# Altium project GTV3.5_Board.PrjPcb (part 1 of 12)
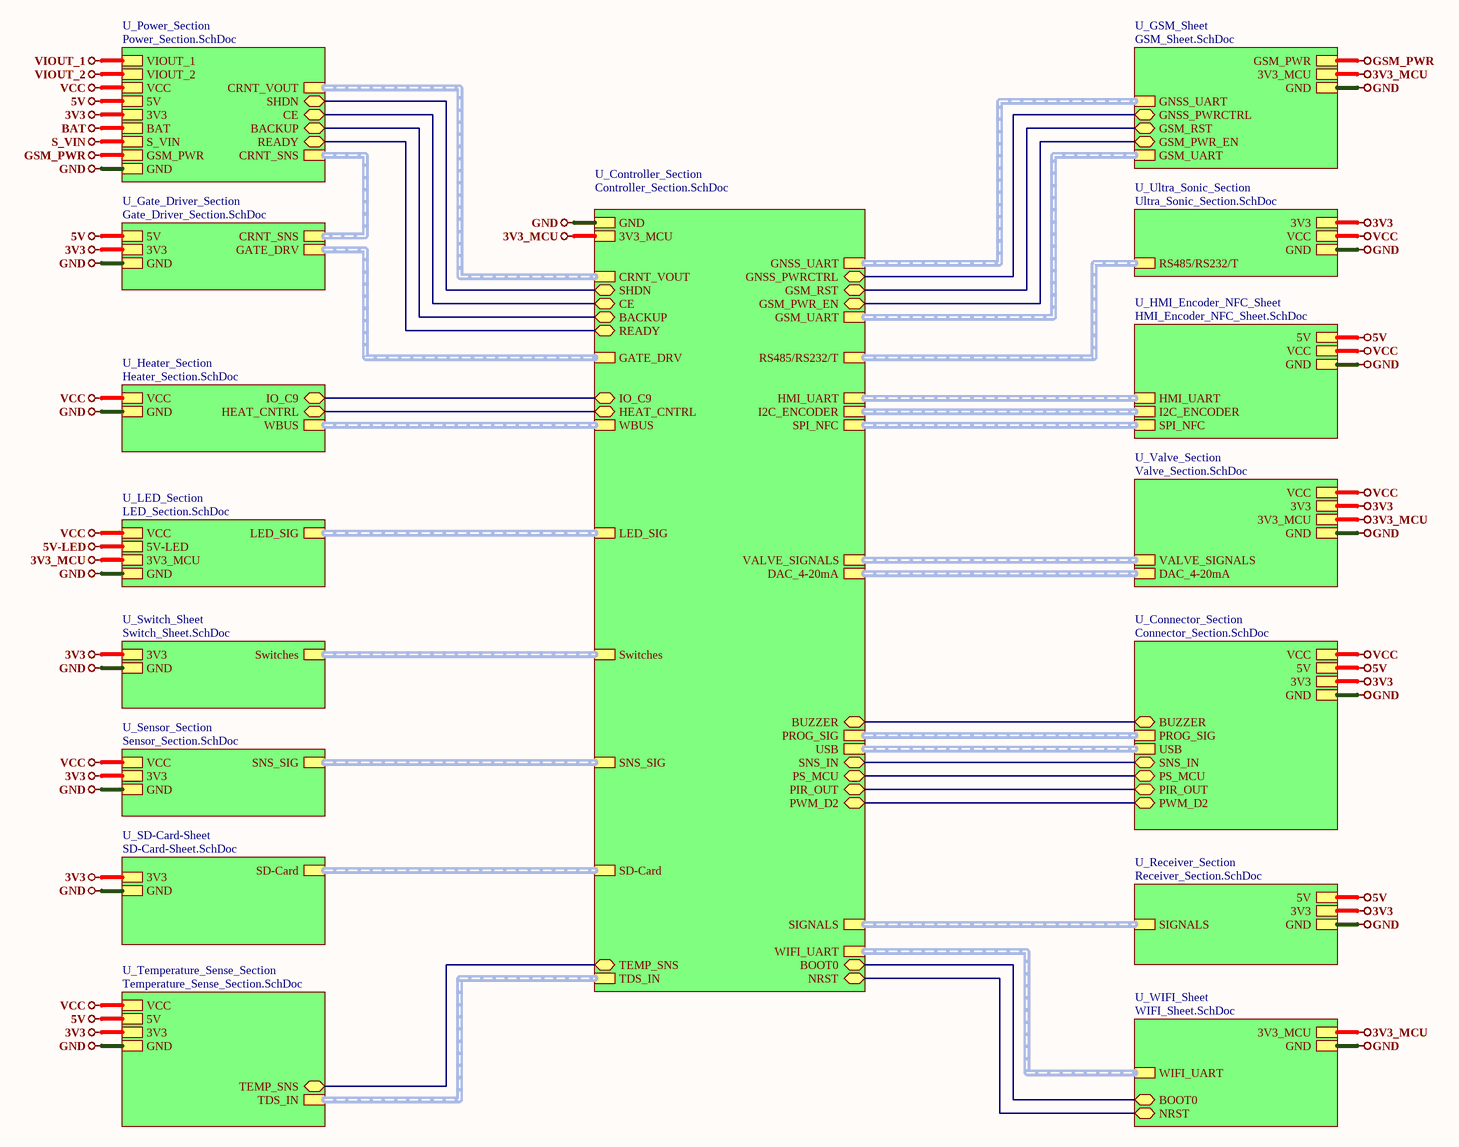
[diagram p0: Top_Sheet.SchDoc]
22 sheets, 594 parts. Net scope: hierarchical (ports join the sheet entries above them; power ports are global).
Board file: PCB_GTV3.5.PcbDoc
Sheets:
  Top_Sheet.SchDoc
    U_Power_Section = Power_Section.SchDoc
      U_Current_Sense_Section = Current_Sense_Section.SchDoc
      U_Voltage_Monitoring_Section = Voltage_Monitoring_Section.SchDoc
      U_Regulator_Section = Regulator_Section.SchDoc
      U_Reverse Protection_Section = Reverse Protection_Section.SchDoc
      U_Solar_Charge_Controller = Solar_Charge_Controller.SchDoc
    U_Connector_Section = Connector_Section.SchDoc
    U_Receiver_Section = Receiver_Section.SchDoc
    U_Controller_Section = Controller_Section.SchDoc
    U_GSM_Sheet = GSM_Sheet.SchDoc
    U_SD-Card-Sheet = SD-Card-Sheet.SchDoc
    U_WIFI_Sheet = WIFI_Sheet.SchDoc
    U_Valve_Section = Valve_Section.SchDoc
    U_Temperature_Sense_Section = Temperature_Sense_Section.SchDoc
    U_Sensor_Section = Sensor_Section.SchDoc
    U_Gate_Driver_Section = Gate_Driver_Section.SchDoc
    U_Switch_Sheet = Switch_Sheet.SchDoc
    U_LED_Section = LED_Section.SchDoc
    U_HMI_Encoder_NFC_Sheet = HMI_Encoder_NFC_Sheet.SchDoc
    U_Ultra_Sonic_Section = Ultra_Sonic_Section.SchDoc
    U_Heater_Section = Heater_Section.SchDoc

## Sheet Top_Sheet.SchDoc
size 420 x 297 mm; DocumentNumber: 1; SheetNumber: 1; SheetTotal: 17

### Sub-sheets
U_Connector_Section = Connector_Section.SchDoc: PROG_SIG (harness PROG_SIG), BUZZER (bidir), VCC, 5V, 3V3, GND, PS_MCU (bidir), SNS_IN (bidir), PIR_OUT (bidir), USB (harness USB), PWM_D2 (bidir)
U_Controller_Section = Controller_Section.SchDoc: PROG_SIG (harness PROG_SIG), BUZZER (bidir), GATE_DRV (harness GATE_DRV), IO_C9 (bidir), GND, 3V3_MCU, SHDN (bidir), Switches (harness Switches), LED_SIG (harness LED_SIG), HEAT_CNTRL (bidir), VALVE_SIGNALS (harness VALVE_SIGNALS), SNS_SIG (harness SNS_SIG), PS_MCU (bidir), SNS_IN (bidir), SIGNALS (harness RF_SIG), PIR_OUT (bidir), CRNT_VOUT (harness CRNT_VOUT), TDS_IN (harness TDS_IN), USB (harness USB), PWM_D2 (bidir), CE (bidir), I2C_ENCODER (harness VALVE_SIGNALS), HMI_UART (harness VALVE_SIGNALS), GSM_UART (harness GSM_UART), GSM_PWR_EN (bidir), GSM_RST (bidir), TEMP_SNS (bidir), SPI_NFC (harness VALVE_SIGNALS), RS485/RS232/T (harness RS485/RS232/T), SD-Card (harness SD-Card), GNSS_PWRCTRL (bidir), READY (bidir), BACKUP (bidir), WIFI_UART (harness PROG_SIG), DAC_4-20mA (harness RF_SIG), BOOT0 (bidir), NRST (bidir), GNSS_UART (harness GSM_UART), WBUS (harness WBUS)
U_Gate_Driver_Section = Gate_Driver_Section.SchDoc: GATE_DRV (harness GATE_DRV), 5V, GND, CRNT_SNS (harness CRNT_SNS), 3V3
U_GSM_Sheet = GSM_Sheet.SchDoc: GSM_UART (harness GSM_UART), GND, GSM_PWR, 3V3_MCU, GSM_RST (bidir), GSM_PWR_EN (bidir), GNSS_PWRCTRL (bidir), GNSS_UART (harness GSM_UART)
U_Heater_Section = Heater_Section.SchDoc: IO_C9 (bidir), VCC, GND, HEAT_CNTRL (bidir), WBUS (harness WBUS)
U_HMI_Encoder_NFC_Sheet = HMI_Encoder_NFC_Sheet.SchDoc: 5V, GND, HMI_UART (harness HMI_UART), I2C_ENCODER (harness ENCODER), VCC, SPI_NFC (harness ENCODER)
U_LED_Section = LED_Section.SchDoc: LED_SIG (harness LED_SIG), VCC, GND, 5V-LED, 3V3_MCU
U_Power_Section = Power_Section.SchDoc: VIOUT_1, VIOUT_2, VCC, 5V, 3V3, GND, CRNT_SNS (harness CRNT_SNS), SHDN (bidir), CRNT_VOUT (harness CRNT_VOUT), BAT, S_VIN, CE (bidir), GSM_PWR, BACKUP (bidir), READY (bidir)
U_Receiver_Section = Receiver_Section.SchDoc: SIGNALS (harness RF_SIG), 5V, GND, 3V3
U_SD-Card-Sheet = SD-Card-Sheet.SchDoc: SD-Card (harness SD-Card), 3V3, GND
U_Sensor_Section = Sensor_Section.SchDoc: SNS_SIG (harness SNS_SIG), VCC, GND, 3V3
U_Switch_Sheet = Switch_Sheet.SchDoc: Switches (harness Switches), GND, 3V3
U_Temperature_Sense_Section = Temperature_Sense_Section.SchDoc: 5V, GND, 3V3, TDS_IN (harness TDS_IN), TEMP_SNS (bidir), VCC
U_Ultra_Sonic_Section = Ultra_Sonic_Section.SchDoc: GND, 3V3, RS485/RS232/T (harness RS485/RS232/T), VCC
U_Valve_Section = Valve_Section.SchDoc: VALVE_SIGNALS (harness VALVE_SIGNALS), VCC, GND, DAC_4-20mA (harness RF_SIG), 3V3, 3V3_MCU
U_WIFI_Sheet = WIFI_Sheet.SchDoc: 3V3_MCU, GND, WIFI_UART (harness PROG_SIG), NRST (bidir), BOOT0 (bidir)

### Nets
3V3: sheet U_Power_Section/3V3, sheet U_Connector_Section/3V3, sheet U_Receiver_Section/3V3, sheet U_SD-Card-Sheet/3V3, sheet U_Valve_Section/3V3, sheet U_Temperature_Sense_Section/3V3, sheet U_Sensor_Section/3V3, sheet U_Gate_Driver_Section/3V3, sheet U_Switch_Sheet/3V3, sheet U_Ultra_Sonic_Section/3V3
3V3_MCU: sheet U_Controller_Section/3V3_MCU, sheet U_GSM_Sheet/3V3_MCU, sheet U_WIFI_Sheet/3V3_MCU, sheet U_Valve_Section/3V3_MCU, sheet U_LED_Section/3V3_MCU
5V: sheet U_Power_Section/5V, sheet U_Connector_Section/5V, sheet U_Receiver_Section/5V, sheet U_Temperature_Sense_Section/5V, sheet U_Gate_Driver_Section/5V, sheet U_HMI_Encoder_NFC_Sheet/5V
GND: sheet U_Power_Section/GND, sheet U_Connector_Section/GND, sheet U_Receiver_Section/GND, sheet U_Controller_Section/GND, sheet U_GSM_Sheet/GND, sheet U_SD-Card-Sheet/GND, sheet U_WIFI_Sheet/GND, sheet U_Valve_Section/GND, sheet U_Temperature_Sense_Section/GND, sheet U_Sensor_Section/GND, sheet U_Gate_Driver_Section/GND, sheet U_Switch_Sheet/GND, sheet U_LED_Section/GND, sheet U_HMI_Encoder_NFC_Sheet/GND, sheet U_Ultra_Sonic_Section/GND, sheet U_Heater_Section/GND
GSM_PWR: sheet U_Power_Section/GSM_PWR, sheet U_GSM_Sheet/GSM_PWR
VCC: sheet U_Power_Section/VCC, sheet U_Connector_Section/VCC, sheet U_Valve_Section/VCC, sheet U_Temperature_Sense_Section/VCC, sheet U_Sensor_Section/VCC, sheet U_LED_Section/VCC, sheet U_HMI_Encoder_NFC_Sheet/VCC, sheet U_Ultra_Sonic_Section/VCC, sheet U_Heater_Section/VCC
VIOUT_1: sheet U_Power_Section/VIOUT_1
VIOUT_2: sheet U_Power_Section/VIOUT_2
BACKUP: sheet U_Power_Section/BACKUP, sheet U_Controller_Section/BACKUP
BOOT0: sheet U_Controller_Section/BOOT0, sheet U_WIFI_Sheet/BOOT0
BUZZER: sheet U_Connector_Section/BUZZER, sheet U_Controller_Section/BUZZER
CE: sheet U_Power_Section/CE, sheet U_Controller_Section/CE
GNSS_PWRCTRL: sheet U_Controller_Section/GNSS_PWRCTRL, sheet U_GSM_Sheet/GNSS_PWRCTRL
GSM_PWR_EN: sheet U_Controller_Section/GSM_PWR_EN, sheet U_GSM_Sheet/GSM_PWR_EN
GSM_RST: sheet U_Controller_Section/GSM_RST, sheet U_GSM_Sheet/GSM_RST
HEAT_CNTRL: sheet U_Controller_Section/HEAT_CNTRL, sheet U_Heater_Section/HEAT_CNTRL
IO_C9: sheet U_Controller_Section/IO_C9, sheet U_Heater_Section/IO_C9
NRST: sheet U_Controller_Section/NRST, sheet U_WIFI_Sheet/NRST
PIR_OUT: sheet U_Connector_Section/PIR_OUT, sheet U_Controller_Section/PIR_OUT
PS_MCU: sheet U_Connector_Section/PS_MCU, sheet U_Controller_Section/PS_MCU
PWM_D2: sheet U_Connector_Section/PWM_D2, sheet U_Controller_Section/PWM_D2
READY: sheet U_Power_Section/READY, sheet U_Controller_Section/READY
SHDN: sheet U_Power_Section/SHDN, sheet U_Controller_Section/SHDN
SNS_IN: sheet U_Connector_Section/SNS_IN, sheet U_Controller_Section/SNS_IN
TEMP_SNS: sheet U_Controller_Section/TEMP_SNS, sheet U_Temperature_Sense_Section/TEMP_SNS

### Buses and harness runs
harness sheet U_Connector_Section/PROG_SIG = sheet U_Controller_Section/PROG_SIG
harness sheet U_Connector_Section/USB = sheet U_Controller_Section/USB
harness sheet U_Controller_Section/CRNT_VOUT = sheet U_Power_Section/CRNT_VOUT
harness sheet U_Controller_Section/DAC_4-20mA = sheet U_Valve_Section/DAC_4-20mA
harness sheet U_Controller_Section/GATE_DRV = sheet U_Gate_Driver_Section/GATE_DRV
harness sheet U_Controller_Section/GNSS_UART = sheet U_GSM_Sheet/GNSS_UART
harness sheet U_Controller_Section/GSM_UART = sheet U_GSM_Sheet/GSM_UART
harness sheet U_Controller_Section/HMI_UART = sheet U_HMI_Encoder_NFC_Sheet/HMI_UART
harness sheet U_Controller_Section/I2C_ENCODER = sheet U_HMI_Encoder_NFC_Sheet/I2C_ENCODER
harness sheet U_Controller_Section/LED_SIG = sheet U_LED_Section/LED_SIG
harness sheet U_Controller_Section/RS485/RS232/T = sheet U_Ultra_Sonic_Section/RS485/RS232/T
harness sheet U_Controller_Section/SD-Card = sheet U_SD-Card-Sheet/SD-Card
harness sheet U_Controller_Section/SIGNALS = sheet U_Receiver_Section/SIGNALS
harness sheet U_Controller_Section/SNS_SIG = sheet U_Sensor_Section/SNS_SIG
harness sheet U_Controller_Section/SPI_NFC = sheet U_HMI_Encoder_NFC_Sheet/SPI_NFC
harness sheet U_Controller_Section/Switches = sheet U_Switch_Sheet/Switches
harness sheet U_Controller_Section/TDS_IN = sheet U_Temperature_Sense_Section/TDS_IN
harness sheet U_Controller_Section/VALVE_SIGNALS = sheet U_Valve_Section/VALVE_SIGNALS
harness sheet U_Controller_Section/WBUS = sheet U_Heater_Section/WBUS
harness sheet U_Controller_Section/WIFI_UART = sheet U_WIFI_Sheet/WIFI_UART
harness sheet U_Gate_Driver_Section/CRNT_SNS = sheet U_Power_Section/CRNT_SNS

### Notes on the sheet
- File:
- Title:
- Date:
- Page
- Num:
- Total:
- Drawn By: Huzaifa Ali

## Sheet Power_Section.SchDoc
size 420 x 297 mm; DocumentNumber: 2; SheetNumber: 2; SheetTotal: 17
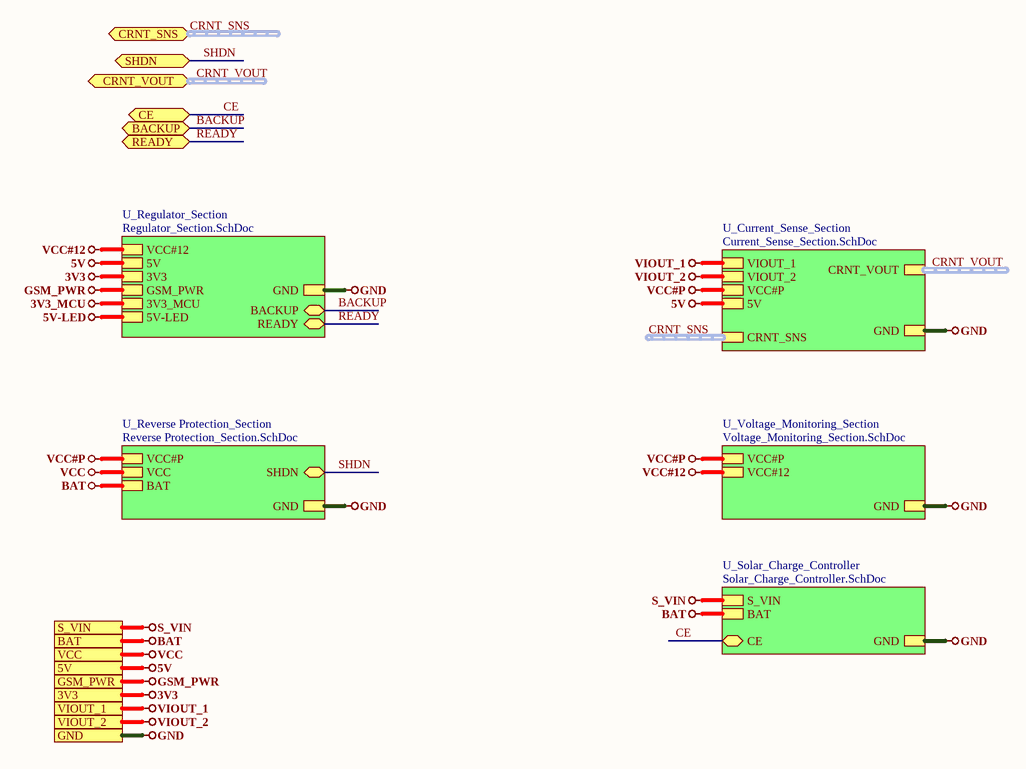
[diagram p1: Power_Section.SchDoc]

### Sub-sheets
U_Current_Sense_Section = Current_Sense_Section.SchDoc: CRNT_SNS (harness CRNT_SNS), VIOUT_1, 5V, VIOUT_2, GND, VCC#P, CRNT_VOUT (harness CRNT_VOUT)
U_Regulator_Section = Regulator_Section.SchDoc: 5V, 3V3, GND, VCC#12, GSM_PWR, BACKUP (bidir), READY (bidir), 3V3_MCU, 5V-LED
U_Reverse Protection_Section = Reverse Protection_Section.SchDoc: SHDN (bidir), VCC#P, GND, VCC, BAT
U_Solar_Charge_Controller = Solar_Charge_Controller.SchDoc: S_VIN, BAT, GND, CE (bidir)
U_Voltage_Monitoring_Section = Voltage_Monitoring_Section.SchDoc: VCC#P, GND, VCC#12

### Ports
3V3, 5V, BACKUP (bidir), BAT, CE (bidir), CRNT_SNS (bidir, harness CRNT_SNS), CRNT_VOUT (bidir, harness CRNT_VOUT), GND, GSM_PWR, READY (bidir), S_VIN, SHDN (bidir), VCC, VIOUT_1, VIOUT_2

### Nets
3V3: port 3V3, sheet U_Regulator_Section/3V3
5V: port 5V, sheet U_Current_Sense_Section/5V, sheet U_Regulator_Section/5V
BAT: port BAT, sheet U_Reverse Protection_Section/BAT, sheet U_Solar_Charge_Controller/BAT
GND: port GND, sheet U_Current_Sense_Section/GND, sheet U_Voltage_Monitoring_Section/GND, sheet U_Regulator_Section/GND, sheet U_Reverse Protection_Section/GND, sheet U_Solar_Charge_Controller/GND
GSM_PWR: port GSM_PWR, sheet U_Regulator_Section/GSM_PWR
S_VIN: port S_VIN, sheet U_Solar_Charge_Controller/S_VIN
VCC: port VCC, sheet U_Reverse Protection_Section/VCC
VCC#12: sheet U_Voltage_Monitoring_Section/VCC#12, sheet U_Regulator_Section/VCC#12
VCC#P: sheet U_Current_Sense_Section/VCC#P, sheet U_Voltage_Monitoring_Section/VCC#P, sheet U_Reverse Protection_Section/VCC#P
VIOUT_1: port VIOUT_1, sheet U_Current_Sense_Section/VIOUT_1
VIOUT_2: port VIOUT_2, sheet U_Current_Sense_Section/VIOUT_2
BACKUP: port BACKUP, sheet U_Regulator_Section/BACKUP
CE: port CE, sheet U_Solar_Charge_Controller/CE
READY: port READY, sheet U_Regulator_Section/READY
SHDN: port SHDN, sheet U_Reverse Protection_Section/SHDN

### Buses and harness runs
harness CRNT_SNS = port CRNT_SNS
harness CRNT_SNS = sheet U_Current_Sense_Section/CRNT_SNS
harness CRNT_VOUT = port CRNT_VOUT
harness CRNT_VOUT = sheet U_Current_Sense_Section/CRNT_VOUT

### Notes on the sheet
- File:
- Title:
- Date:
- Page
- Num:
- Total:
- Drawn By: Huzaifa Ali

## Sheet Current_Sense_Section.SchDoc
size 420 x 297 mm; DocumentNumber: 5; SheetNumber: 5; SheetTotal: 17
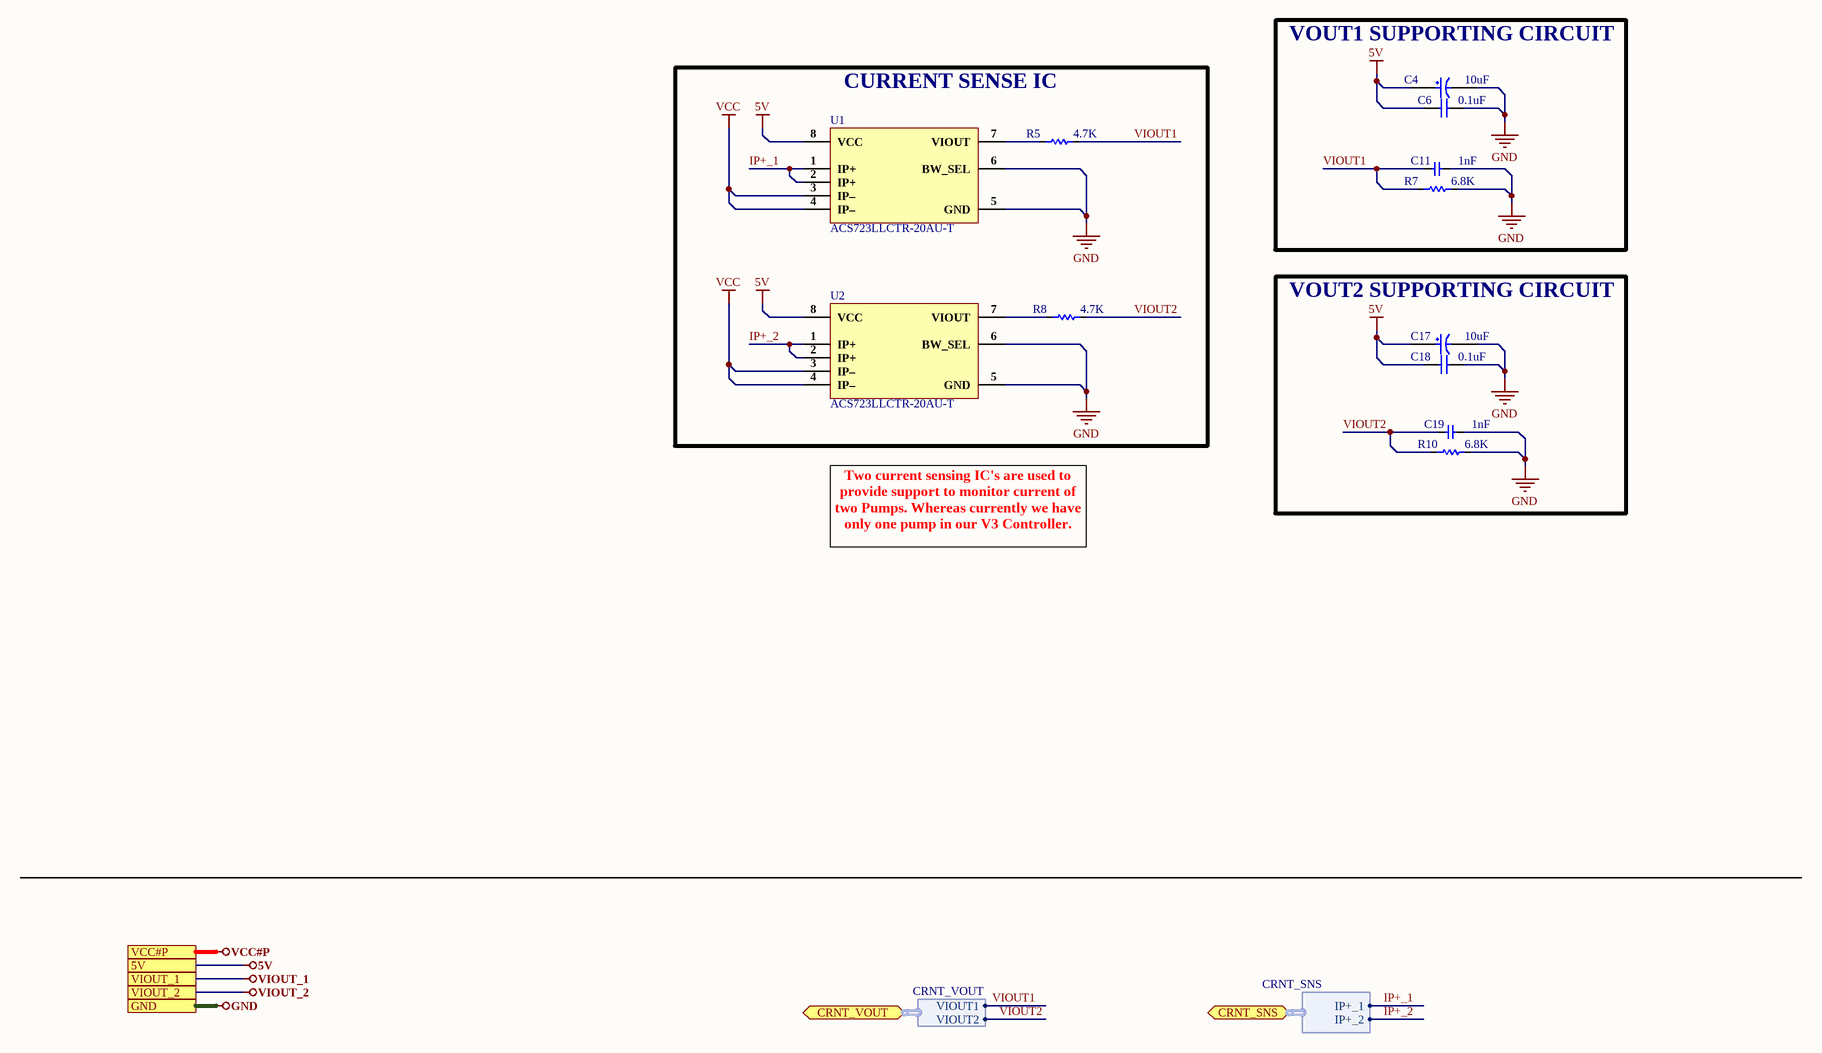
[diagram p2: Current_Sense_Section.SchDoc]

### Parts
C4  10uF  [RVT1E100M0405.]
C6  0.1uF  [Cap0603]
C11  1nF  [Cap-0402]
C17  10uF  [RVT1E100M0405.]
C18  0.1uF  [Cap0603]
C19  1nF  [Cap-0402]
R5  4.7K  [Res-0603]
R7  6.8K  [Res-0603]
R8  4.7K  [Res-0603]
R10  6.8K  [Res-0603]
U1  ACS723LLCTR-20AU-T  [SOIC-8]
U2  ACS723LLCTR-20AU-T  [SOIC-8]

### Blocks framed on the sheet
VOUT1 SUPPORTING CIRCUIT: C4 C6 C11 R7
CURRENT SENSE IC: R5 R8 U1 U2
VOUT2 SUPPORTING CIRCUIT: C17-C19 R10

### Ports
5V, CRNT_SNS (bidir, harness CRNT_SNS), CRNT_VOUT (bidir, harness CRNT_VOUT), GND, VCC#P, VIOUT_1, VIOUT_2

### Harnesses
CRNT_SNS: IP+_1, IP+_2
CRNT_VOUT: VIOUT1, VIOUT2

### Nets
5V: C4.1 C6.1 C17.1 C18.1 U1.8(VCC) U2.8(VCC) ; port 5V
GND: C4.2 C6.2 C11.2 C17.2 C18.2 C19.2 R7.2 R10.2 U1.5(GND) U1.6(BW_SEL) U2.5(GND) U2.6(BW_SEL) ; port GND
VCC: U1.3(IP–) U1.4(IP–) U2.3(IP–) U2.4(IP–)
VIOUT_1: port VIOUT_1
VIOUT_2: port VIOUT_2
IP+_1: U1.1(IP+) U1.2(IP+) ; port CRNT_SNS.IP+_1  [project net CRNT_SNS.IP+_1]
IP+_2: U2.1(IP+) U2.2(IP+) ; port CRNT_SNS.IP+_2  [project net CRNT_SNS.IP+_2]
VIOUT1: C11.1 R5.2 R7.1 ; port CRNT_VOUT.VIOUT1  [project net CRNT_VOUT.VIOUT1]
VIOUT2: C19.1 R8.2 R10.1 ; port CRNT_VOUT.VIOUT2  [project net CRNT_VOUT.VIOUT2]
NetR5_1: R5.1 U1.7(VIOUT)
NetR8_1: R8.1 U2.7(VIOUT)

### Notes on the sheet
- Two current sensing IC's are used to provide support to monitor current of two Pumps. Whereas currently we have only one pump in our V3 Controller.
- File:
- Title:
- Date:
- Page
- Num:
- Total:
- Drawn By: Huzaifa Ali

### Library data of the parts
C4 C17 = RVT1E100M0405: CAP ALUM 10uF 25V SMD; Manufacturer: ROQANG; φD: 4mm; L: 5.4mm; Tolerance: ±20%; Operating Temperature: -45℃~+105℃; Rated Voltage: 25V; Capacitance: 10uF
C6 C18 = CC0603ZRY5V9BB104: CAP CER 0.1UF 50V Y5V 0603; Manufacturer: Yageo; Capacitance: 100nF; Tolerance: 80%; Supplier 1: Digi-Key; Manufacturer Part Number: CC0603ZRY5V9BB104; Stock 1: 15000880; Pricing 1: 1=0.1, 10=0.075, 100=0.0334, 500=0.02386, 1000=0.01874 (USD); Mount: Surface Mount; Case/Package: 0603; Number of Pins: 2; Case Code (Metric): 1608; Case Code (Imperial): 0603; Min Operating Temperature: -30°C; Max Operating Temperature: 85°C; Dielectric: Y5V; Voltage Rating: 50V; Package Quantity: 1; Packaging: Tape and Reel; Voltage Rating (DC): 50V; Termination: SMD/SMT; Composition: Ceramic; Voltage: 50V; Length: 1.6mm; Height: 0.8mm; Width: 0.031inch; Thickness: 0.035inch; Depth: 0.8mm; Radiation Hardening: No; REACH SVHC: No SVHC; Lead Free: Lead Free; Halogen Free: Halogen Free; ComponentLink1URL: http://www.yageo.com/documents/recent/UPY-GPHC_Y5V_6.3V-to-50V_8.pdf?src-supplier=Digi-Key; ComponentLink1Description: http://www.yageo.com/documents/recent/UPY-GPHC_Y5V_6.3V-to-50V_8.pdf?src-supplier=Digi-Key; ComponentLink2URL: http://www.yageo.com/documents/recent/UPY-GPHC_Y5V_6.3V-to-50V_5.pdf?src-supplier=Avnet+Europe; ComponentLink2Description: http://www.yageo.com/documents/recent/UPY-GPHC_Y5V_6.3V-to-50V_5.pdf?src-supplier=Avnet+Europe; ComponentLink3URL: https://www.verical.com/server-webapp/html/getDatasheet?partID=403611&src-supplier=Verical; ComponentLink3Description: https://www.verical.com/server-webapp/html/getDatasheet?partID=403611&src-supplier=Verical; ComponentLink4URL: http://www.mouser.com/ds/2/447/Yageo_UPY-GP_NP0_16V-to-50V_9-358835.pdf?src-supplier=Mouser; ComponentLink4Description: http://www.mouser.com/ds/2/447/Yageo_UPY-GP_NP0_16V-to-50V_9-358835.pdf?src-supplier=Mouser; ComponentLink5URL: http://www.farnell.com/datasheets/1132289.pdf?src-supplier=Element14; ComponentLink5Description: http://www.farnell.com/datasheets/1132289.pdf?src-supplier=Element14; Supplier Part Number 1: 311-1343-1-ND
C11 C19 = C1005C0G1E102JT000F: CAP CER 1000PF 25V C0G 0402; Manufacturer: TDK; Item Type: Capacitor; ComponentLink1Description: LCSC; ComponentLink1URL: https://www.lcsc.com/product-detail/Multilayer-Ceramic-Capacitors-MLCC-SMD-SMT_TDK-C1005C0G1E102JT000F_C343059.html; Manufacturer Part Number: C1005C0G1E102JT000F; Package: 0402; LCSC Part Number: C343059
R5 R8 = AT0603BRD074K7L: RES SMD 4.7K OHM 0.1% 1/10W 0603; Manufacturer: Yageo; Resistance: 4.7kR; Max Power Dissipation: 100mW; Temperature Coefficient: 25ppm/°C; Item Type: Resistor; Supplier 1: Digi-Key; Manufacturer Part Number: AT0603BRD074K7L; Stock 1: 7928; Pricing 1: 1=0.56, 10=0.431, 100=0.181, 1000=0.09986, 2500=0.09362 (USD); Case/Package: 0603; Case Code (Metric): 1608; Case Code (Imperial): 0603; Min Operating Temperature: -55°C; Max Operating Temperature: 155°C; Packaging: Tape and Reel; Composition: Thin Film; Number of Terminations: 2; Tolerance: 0.1%; Features: Anti-Sulfur,Automotive AEC-Q200,Moisture Resistant; Length: 0.063inch; Height: 0.022inch; Width: 0.032inch; Supplier Part Number 1: YAG2113CT-ND; LCSC Part Number: C855887
R7 R10 = RT0603BRE076K8L: RES SMD 6.8K OHM 0.1% 1/10W 0603; Manufacturer: Yageo; Power: 100mW; Rated Temperature: 70°C; Value: 6.8kR; Temperature Coefficient: 50ppm/°C; Working Voltage: 75V; Package Height: 0.45mm; Package Length: 1.6mm; Package Width: 0.8mm; Item Type: Resistor; Supplier 1: Mouser; Manufacturer Part Number: RT0603BRE076K8L; RoHS: Yes; Category: Chip SMD Resistors; Stock 1: 1191; Pricing 1: 1=0.32000, 10=0.26800, 50=0.26800, 100=0.10500, 1000=0.04400, 10000=0.03600 (USD); Mounting Technology: Surface Mount; Pins: 2; Case/Package: 0603; Min Operating Temperature: -55°C; Max Operating Temperature: 155°C; Tolerance: 0.1%; Resistor Type: FIXED RESISTOR; Construction: Chip; Package Style: SMTMeter; Packaging: Tape and Reel; Technology: THIN FILM; Termination: Wraparound; Reach SVHC Compliant: Yes; RoHS Compliant: Yes; ComponentLink1URL: https://datasheet.ciiva.com:443/pdfs/VipMasterIC/IC/YAGO/YAGO-S-A0008510989/YAGO-S-A0008510989-1.pdf?src-supplier=IHS+Markit; ComponentLink1Description: https://datasheet.ciiva.com:443/pdfs/VipMasterIC/IC/YAGO/YAGO-S-A0008510989/YAGO-S-A0008510989-1.pdf?src-supplier=IHS+Markit; ComponentLink2URL: https://datasheet.ciiva.com/2584/pyu-rt-1-to-0-05-rohs-l-5-2584607.pdf?src-supplier=Digi-Key; ComponentLink2Description: https://datasheet.ciiva.com/2584/pyu-rt-1-to-0-05-rohs-l-5-2584607.pdf?src-supplier=Digi-Key; Supplier Part Number 1: 603-RT0603BRE076K8L; LCSC Part Number: C705876
U1 U2 = ACS723LLCTR-20AU-T: SENSOR CURRENT HALL 20A DC; Manufacturer: Allegro MicroSystems; Number of Channels: 1; Frequency: 80kHz; Response Time: 5us; Max Supply Current: 14mA; Polarity: Unidirectional; Linearity: 1%; Accuracy: 3%; Sensitivity: 200mV/A; Supplier 1: Digi-Key; Manufacturer Part Number: ACS723LLCTR-20AU-T; RoHS: Yes; Category: Current Sensors; Pricing 1: 1=4.46000, 5=3.94000, 10=3.47900, 25=2.82280, 50=2.49480, 100=2.42900, 500=2.03516, 1000=1.90385 (USD); Mount: Surface Mount; Case/Package: SOIC; Number of Pins: 8; Min Operating Temperature: -40°C; Max Operating Temperature: 150°C; Packaging: Tape and Reel; Current Sensing: 20A; RoHS Compliant: Yes; ComponentLink1URL: http://www.farnell.com/datasheets/2838158.pdf?src-supplier=Farnell; ComponentLink1Description: http://www.farnell.com/datasheets/2838158.pdf?src-supplier=Farnell; ComponentLink2URL: http://www.farnell.com/datasheets/2838158.pdf?src-supplier=Newark; ComponentLink2Description: http://www.farnell.com/datasheets/2838158.pdf?src-supplier=Newark; ComponentLink3URL: http://www.allegromicro.com/~/media/Files/Datasheets/ACS723-Datasheet.ashx?src-supplier=Digi-Key; ComponentLink3Description: http://www.allegromicro.com/~/media/Files/Datasheets/ACS723-Datasheet.ashx?src-supplier=Digi-Key; ComponentLink4URL: https://www.allegromicro.com/~/media/Files/Datasheets/ACS723-Datasheet.ashx?src-supplier=Digi-Key; ComponentLink4Description: https://www.allegromicro.com/~/media/Files/Datasheets/ACS723-Datasheet.ashx?src-supplier=Digi-Key; Supplier Part Number 1: 620-1645-1-ND

## Sheet Voltage_Monitoring_Section.SchDoc
size 420 x 297 mm; DocumentNumber: 4; SheetNumber: 4; SheetTotal: 17
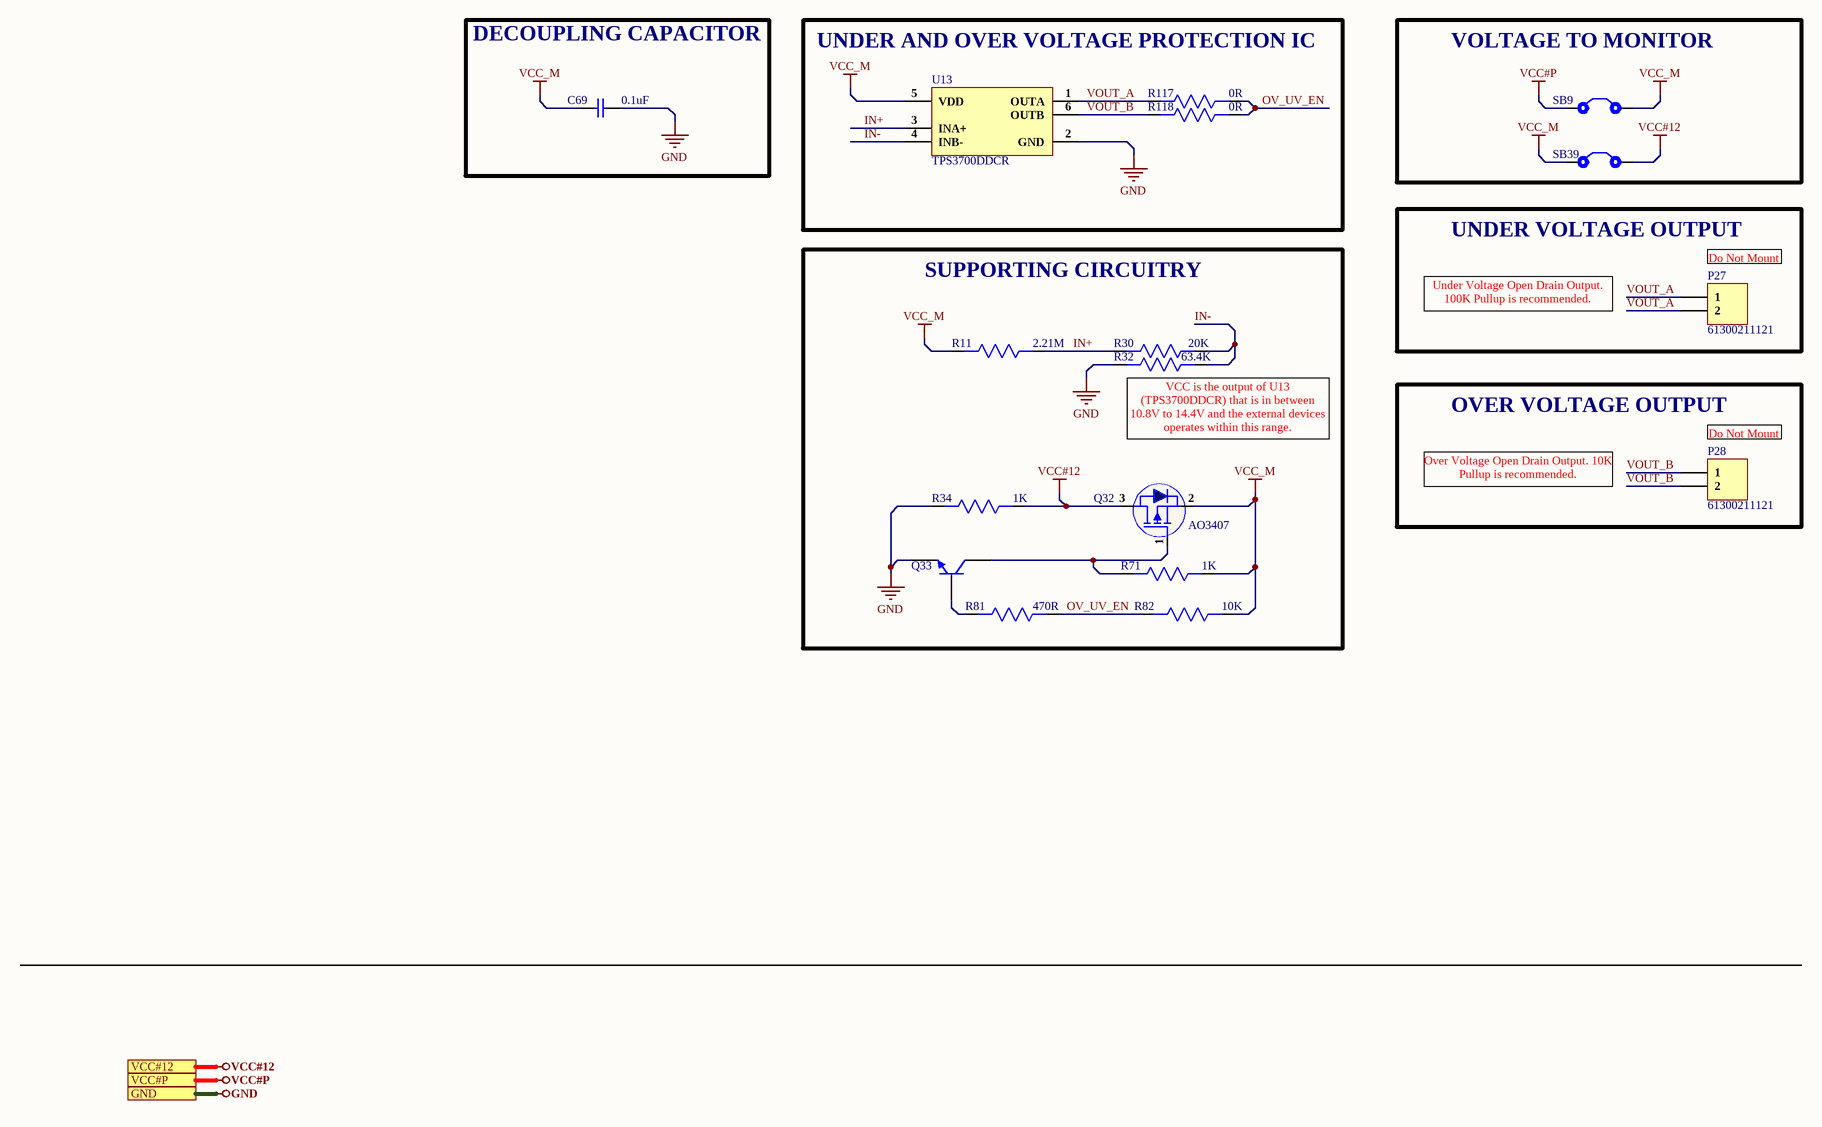
[diagram p3: Voltage_Monitoring_Section.SchDoc]

### Parts
C69  0.1uF  [Cap0603]
P27  61300211121  [HDR1X2]
P28  61300211121  [HDR1X2]
Q32  AO3407  [SOT-23]
Q33  MMBT2222A-7-F  [SOT-23]  (value not drawn)
R11  2.21M  [RES-0603]
R30  20K  [Res-0603]
R32  63.4K  [Res-0603]
R34  1K  [RES-0603]
R71  1K  [RES-0603]
R81  470R  [Res-0603]
R82  10K  [Res-0603]
R117  0R  [Res-0603]
R118  0R  [Res-0603]
SB9  Solder Bridge  [Solder Bridge]  (value not drawn)
SB39  Solder Bridge  [Solder Bridge]  (value not drawn)
U13  TPS3700DDCR  [SOT-23-6]

### Blocks framed on the sheet
DECOUPLING CAPACITOR: C69
UNDER AND OVER VOLTAGE PROTECTION IC: R117 R118 U13
VOLTAGE TO MONITOR: SB9 SB39
UNDER VOLTAGE OUTPUT: P27
SUPPORTING CIRCUITRY: Q32 Q33 R11 R30 R32 R34 R71 R81 R82
OVER VOLTAGE OUTPUT: P28

### Ports
GND, VCC#12, VCC#P

### Nets
GND: C69.2 Q33.2(E) R32.2 R34.2 U13.2(GND) ; port GND
VCC#12: Q32.3(D) R34.1 SB39.2 ; port VCC#12
VCC#P: SB9.1 ; port VCC#P
VCC_M: C69.1 Q32.2(S) R11.2 R71.1 R82.1 SB9.2 SB39.1 U13.5(VDD)
IN+: R11.1 R30.2 U13.3(INA+)
IN-: R30.1 R32.1 U13.4(INB-)
OV_UV_EN: R81.1 R82.2 R117.1 R118.1
VOUT_A: P27.1 P27.2 R117.2 U13.1(OUTA)
VOUT_B: P28.1 P28.2 R118.2 U13.6(OUTB)
NetQ32_1: Q32.1(G) Q33.3(C) R71.2
NetQ33_1: Q33.1(B) R81.2

### Notes on the sheet
- Under Voltage Open Drain Output. 100K Pullup is recommended.
- (near P27) Do Not Mount
- (near R32) VCC is the output of U13 (TPS3700DDCR) that is in between 10.8V to 14.4V and the external devices operates within this range.
- (near P28) Do Not Mount
- Over Voltage Open Drain Output. 10K Pullup is recommended.
- File:
- Title:
- Date:
- Page
- Num:
- Total:
- Drawn By: Huzaifa Ali

### Library data of the parts
C69 = CC0603ZRY5V9BB104: as C6 on sheet Current_Sense_Section; Supplier 1: Digi-Key; Manufacturer Part Number: CC0603ZRY5V9BB104; Stock 1: 15000880; Pricing 1: 1=0.1, 10=0.075, 100=0.0334, 500=0.02386, 1000=0.01874 (USD); Mount: Surface Mount; Case/Package: 0603; Number of Pins: 2; Case Code (Metric): 1608; Case Code (Imperial): 0603; Min Operating Temperature: -30°C; Max Operating Temperature: 85°C; Dielectric: Y5V; Voltage Rating: 50V; Package Quantity: 1; Packaging: Tape and Reel; Voltage Rating (DC): 50V; Termination: SMD/SMT; Composition: Ceramic; Voltage: 50V; Length: 1.6mm; Height: 0.8mm; Width: 0.031inch; Thickness: 0.035inch; Depth: 0.8mm; Radiation Hardening: No; REACH SVHC: No SVHC; Lead Free: Lead Free; Halogen Free: Halogen Free; ComponentLink1URL: http://www.yageo.com/documents/recent/UPY-GPHC_Y5V_6.3V-to-50V_8.pdf?src-supplier=Digi-Key; ComponentLink1Description: http://www.yageo.com/documents/recent/UPY-GPHC_Y5V_6.3V-to-50V_8.pdf?src-supplier=Digi-Key; ComponentLink2URL: http://www.yageo.com/documents/recent/UPY-GPHC_Y5V_6.3V-to-50V_5.pdf?src-supplier=Avnet+Europe; ComponentLink2Description: http://www.yageo.com/documents/recent/UPY-GPHC_Y5V_6.3V-to-50V_5.pdf?src-supplier=Avnet+Europe; ComponentLink3URL: https://www.verical.com/server-webapp/html/getDatasheet?partID=403611&src-supplier=Verical; ComponentLink3Description: https://www.verical.com/server-webapp/html/getDatasheet?partID=403611&src-supplier=Verical; ComponentLink4URL: http://www.mouser.com/ds/2/447/Yageo_UPY-GP_NP0_16V-to-50V_9-358835.pdf?src-supplier=Mouser; ComponentLink4Description: http://www.mouser.com/ds/2/447/Yageo_UPY-GP_NP0_16V-to-50V_9-358835.pdf?src-supplier=Mouser; ComponentLink5URL: http://www.farnell.com/datasheets/1132289.pdf?src-supplier=Element14; ComponentLink5Description: http://www.farnell.com/datasheets/1132289.pdf?src-supplier=Element14; Supplier Part Number 1: 311-1343-1-ND
P27 P28 = Header 1x2: CONN HEADER VERT 2POS 2.54MM; Manufacturer: Wurth Electronics; Current Rating: 3A; Voltage Rating: 250V; Number of Positions: 2; Gender: Male; Connector Type: Male Pin; Pitch: 0.1inch; Supplier 1: Digi-Key; Manufacturer Part Number: 61300211121; Stock 1: 219205; Pricing 1: 1=0.13, 10=0.106, 25=0.088, 50=0.074, 100=0.067, 1000=0.061 (USD); Mount: Through Hole; Contact Plating: Gold; Housing Material: PBT; Contact Material: Copper Alloy,Copper; Color: Black; Min Operating Temperature: -40°C; Max Operating Temperature: 125°C; Number of Rows: 1; Contact Gender: Male; Packaging: Bulk; Termination: Through Hole; Number of Contacts: 2; Contact Mating Length: 0.236inch; REACH SVHC: Unknown; Lead Free: Lead Free; ComponentLink1URL: http://www.mouser.com/ds/2/445/6130xx11121-538006.pdf?src-supplier=Mouser; ComponentLink1Description: http://www.mouser.com/ds/2/445/6130xx11121-538006.pdf?src-supplier=Mouser; Supplier Part Number 1: 732-5315-ND
Q32 = AO3407: 30V 4.1A 60mΩ@10V,4.1A 350mW 3V@250uA P Channel SOT-23 MOSFETs ROHS; Manufacturer: Guangdong Hottech; Item Type: Mosfet; Manufacturer Part Number: AO3407; Package: SOT-23; LCSC Part Number: C181093; ComponentLink1Description: LCSC; ComponentLink1URL: https://www.lcsc.com/product-detail/MOSFETs_Guangdong-Hottech-AO3407_C181093.html
Q33 = MMBT2222A-7-F: TRANS NPN 40V 0.6A SMD SOT23-3; Manufacturer: Diodes; Max Power Dissipation: 300mW; Collector Base Voltage (VCBO): 75V; Max Collector Current: 600mA; hFE Min: 100; Frequency: 300MHz; Number of Elements: 1; Emitter Base Voltage (VEBO): 6V; Collector Emitter Saturation Voltage: 1V; Power Dissipation: 350mW; Element Configuration: Single; Current: 1A; Supplier 1: Digi-Key; Manufacturer Part Number: MMBT2222A-7-F; Stock 1: 2471182; Pricing 1: 1=0.15, 10=0.134, 100=0.0729, 500=0.04486, 1000=0.03059 (USD); Mount: Surface Mount; Case/Package: SOT-23; Number of Pins: 3; Weight: 0.000282oz; Contact Plating: Matte,Tin; Min Operating Temperature: -55°C; Max Operating Temperature: 150°C; Packaging: Tape and Reel; Collector Emitter Voltage (VCEO): 40V; Polarity: NPN; Voltage Rating (DC): 40V; Package Quantity: 3000; Continuous Collector Current: 600mA; Collector Emitter Breakdown Voltage: 40V; Transition Frequency: 300MHz; Max Breakdown Voltage: 40V; Max Frequency: 300MHz; Termination: SMD/SMT; Gain Bandwidth Product: 300MHz; Current Rating: 600mA; Voltage: 40V; Length: 3.05mm; Height: 1mm; Width: 1.4mm; Radiation Hardening: No; Lead Free: Lead Free; REACH SVHC: No SVHC; ComponentLink1URL: http://www.diodes.com/datasheets/ds30041.pdf?src-supplier=Future+Electronics; ComponentLink1Description: http://www.diodes.com/datasheets/ds30041.pdf?src-supplier=Future+Electronics; ComponentLink2URL: http://www.diodes.com/datasheets/ds30041.pdf?src-supplier=Avnet; ComponentLink2Description: http://www.diodes.com/datasheets/ds30041.pdf?src-supplier=Avnet; ComponentLink3URL: https://www.verical.com/server-webapp/html/getDatasheet?partID=82692&src-supplier=Verical; ComponentLink3Description: https://www.verical.com/server-webapp/html/getDatasheet?partID=82692&src-supplier=Verical; ComponentLink4URL: https://www.diodes.com/assets/Datasheets/ds30041.pdf?src-supplier=Digi-Key; ComponentLink4Description: https://www.diodes.com/assets/Datasheets/ds30041.pdf?src-supplier=Digi-Key; ComponentLink5URL: http://www.diodes.com/datasheets/ds30041.pdf?src-supplier=Avnet+Europe; ComponentLink5Description: http://www.diodes.com/datasheets/ds30041.pdf?src-supplier=Avnet+Europe; ComponentLink6URL: http://www.diodes.com/datasheets/ds30041.pdf?src-supplier=Element14; ComponentLink6Description: http://www.diodes.com/datasheets/ds30041.pdf?src-supplier=Element14; Supplier Part Number 1: MMBT2222A-FDIDKR-ND; LCSC Part Number: C94515
R11 = 0603WAF2214T5E: 100mW Thick Film Resistors 75V ±1% ±100ppm/℃ -55℃~+155℃ 2.21MΩ 0603 Chip Resistor - Surface Mount ROHS; Manufacturer: UNI-ROYAL; Manufacturer Part Number: 0603WAF2214T5E; Footprint: 0603; ComponentLink1Description: LCSC; ComponentLink1URL: https://www.lcsc.com/product-detail/Chip-span-style-background-color-ff0-Resistor-span-Surface-Mount_UNI-ROYAL-Uniroyal-Elec-0603WAF2214T5E_C422956.html
R30 = RT0603BRD0720KL: RES SMD 20K OHM 0.1% 1/10W 0603; Manufacturer: Yageo; Power Rating: 100mW; Temperature Coefficient: 25ppm/°C; Resistance: 20kR; Voltage Rating: 75V; Voltage Rating (DC): 50V; Supplier 1: Mouser; Manufacturer Part Number: RT0603BRD0720KL; RoHS: Yes; Category: Chip SMD Resistors; Stock 1: 60572; Pricing 1: 1=0.35000, 10=0.23500, 50=0.23500, 100=0.10000, 1000=0.05000, 10000=0.03900 (USD); Case/Package: 0603; Case Code (Imperial): 0603; Case Code (Metric): 1608; Weight: 7.1E-05oz; Contact Plating: Tin,Lead; Size Code: 0603; Min Operating Temperature: -55°C; Max Operating Temperature: 125°C; Tolerance: 0.1%; Packaging: Tape and Reel; Package Quantity: 5000; Resistor Type: Thin Film; Termination: SMD/SMT; Number of Terminations: 2; Max Power Dissipation: 100mW; Features: Moisture Resistant; Series: RT; Construction: Rectangular; Length: 1.6mm; Width: 0.8mm; Height: 0.022inch; Depth: 0.8mm; RoHS Compliant: Yes; Military Standard: Not; Lead Free: Lead Free; ComponentLink1URL: https://datasheet.ciiva.com/2585/pyu-rt-1-to-0-05-rohs-l-4-2585771.pdf?src-supplier=Digi-Key; ComponentLink1Description: https://datasheet.ciiva.com/2585/pyu-rt-1-to-0-05-rohs-l-4-2585771.pdf?src-supplier=Digi-Key; ComponentLink2URL: https://datasheet.ciiva.com/46634/pyu-rt-1-to-0-05-rohs-l-5-46634970.pdf?src-supplier=Digi-Key; ComponentLink2Description: https://datasheet.ciiva.com/46634/pyu-rt-1-to-0-05-rohs-l-5-46634970.pdf?src-supplier=Digi-Key; Supplier Part Number 1: 603-RT0603BRD0720KL
R32 = RT0603BRE0763K4L: RES SMD 63.4KOHM 0.1% 1/10W 0603; Manufacturer: Yageo; Resistance: 63.4kR; Max Power Dissipation: 100mW; Temperature Coefficient: 50ppm/°C; Voltage Rating (DC): 50V; Supplier 1: Mouser; Manufacturer Part Number: RT0603BRE0763K4L; RoHS: Yes; Category: Chip SMD Resistors; Pricing 1: 1=0.42000, 10=0.30200, 50=0.30200, 100=0.12100, 1000=0.06000, 10000=0.04500 (USD); Case/Package: 0603; Min Operating Temperature: -55°C; Max Operating Temperature: 125°C; Package Quantity: 5000; Packaging: Tape and Reel; Tolerance: 0.1%; Resistor Type: Thin Film; Number of Terminations: 2; Series: RT; Length: 0.063inch; Width: 0.031inch; Height: 0.022inch; Lead Free: Lead Free; RoHS Compliant: Yes; ComponentLink1URL: https://datasheet.ciiva.com/2584/pyu-rt-1-to-0-05-rohs-l-5-2584583.pdf?src-supplier=Digi-Key; ComponentLink1Description: https://datasheet.ciiva.com/2584/pyu-rt-1-to-0-05-rohs-l-5-2584583.pdf?src-supplier=Digi-Key; Supplier Part Number 1: 603-RT0603BRE0763K4L
R34 R71 = RC0603FR-071KL: RES SMD 1K OHM 1% 1/10W 0603; Manufacturer: Yageo; Resistance: 1kR; Temperature Coefficient: 100ppm/°C; Power Rating: 100mW; Voltage Rating: 50V; ComponentLink1URL: https://www.verical.com/server-webapp/html/getDatasheet?partID=409289&src-supplier=Verical; ComponentLink1Description: https://www.verical.com/server-webapp/html/getDatasheet?partID=409289&src-supplier=Verical; Supplier 1: Digi-Key; Manufacturer Part Number: RC0603FR-071KL; Stock 1: 21472395; Pricing 1: 1=0.1, 10=0.023, 100=0.0094, 1000=0.0042, 2500=0.0037 (USD); Case/Package: 0603; Contact Plating: Tin,Matte; Case Code (Imperial): 0603; Case Code (Metric): 1608; Min Operating Temperature: -55°C; Max Operating Temperature: 155°C; Tolerance: 1%; Composition: Thick Film; Packaging: Tape and Reel; Termination: SMD/SMT; Military Standard: Not; Length: 1.6mm; Height: 0.45mm; Depth: 0.8mm; Radiation Hardening: No; REACH SVHC: No SVHC; Lead Free: Lead Free; ComponentLink2URL: http://documents.rs-components.com/techlib://itc_doclist_GB.htm?stockno=5048928&src-supplier=RSComponents; ComponentLink2Description: http://documents.rs-components.com/techlib://itc_doclist_GB.htm?stockno=5048928&src-supplier=RSComponents; ComponentLink3URL: http://www.yageo.com/documents/recent/PYu-RC0603_51_RoHS_L_4.pdf?src-supplier=Avnet+Europe; ComponentLink3Description: http://www.yageo.com/documents/recent/PYu-RC0603_51_RoHS_L_4.pdf?src-supplier=Avnet+Europe; ComponentLink4URL: http://www.farnell.com/datasheets/2167052.pdf?src-supplier=Element14; ComponentLink4Description: http://www.farnell.com/datasheets/2167052.pdf?src-supplier=Element14; ComponentLink5URL: http://www.farnell.com/datasheets/1868787.pdf?src-supplier=Element14; ComponentLink5Description: http://www.farnell.com/datasheets/1868787.pdf?src-supplier=Element14; ComponentLink6URL: http://www.yageo.com/documents/recent/PYu-RC_Group_51_RoHS_L_2.pdf?src-supplier=Avnet; ComponentLink6Description: http://www.yageo.com/documents/recent/PYu-RC_Group_51_RoHS_L_2.pdf?src-supplier=Avnet; ComponentLink7URL: https://www.verical.com/server-webapp/html/getDatasheet?partID=404327&src-supplier=Verical; ComponentLink7Description: https://www.verical.com/server-webapp/html/getDatasheet?partID=404327&src-supplier=Verical; ComponentLink8URL: http://www.farnell.com/datasheets/443971.pdf?src-supplier=Element14; ComponentLink8Description: http://www.farnell.com/datasheets/443971.pdf?src-supplier=Element14; Supplier Part Number 1: 311-1.00KHRDKR-ND
R81 = RC0603FR-07470RL: RES 470 OHM 1% 1/10W 0603; Manufacturer: Yageo; Power Rating: 100mW; Voltage Rating: 50V; Temperature Coefficient: 100ppm/°C; Working Voltage: 75V; Supplier 1: Digi-Key; Manufacturer Part Number: RC0603FR-07470RL; RoHS: Yes; Category: Chip SMD Resistors; Stock 1: 154083; Pricing 1: 1=0.10000, 10=0.02400, 100=0.00970, 1000=0.00436, 2500=0.00378 (USD); Case/Package: 0603; Case Code (Metric): 1608; Case Code (Imperial): 0603; Min Operating Temperature: -55°C; Max Operating Temperature: 155°C; Tolerance: 1%; Resistance: 470R; Packaging: Tape and Reel; Package Quantity: 1; Resistor Type: Thick Film; Number of Terminations: 2; Termination: SMD/SMT; Max Power Dissipation: 100mW; Features: Moisture Resistant; Series: RC; Technology: THICK FILM; Resistance Tolerance: 1%; Construction: Rectangular; Length: 1.6mm; Width: 0.031inch; Height: 0.022inch; Depth: 0.8mm; RoHS Compliant: Yes; REACH SVHC: No SVHC; Military Standard: Not; Lead Free: Lead Free; ComponentLink1URL: https://datasheet.ciiva.com/11808/0900766b80f96399-11808177.pdf?src-supplier=RSComponents; ComponentLink1Description: https://datasheet.ciiva.com/11808/0900766b80f96399-11808177.pdf?src-supplier=RSComponents; ComponentLink2URL: https://datasheet.ciiva.com/7746/1738695-7746359.pdf?src-supplier=Element14; ComponentLink2Description: https://datasheet.ciiva.com/7746/1738695-7746359.pdf?src-supplier=Element14; ComponentLink3URL: https://datasheet.ciiva.com/7746/1738695-7746360.pdf?src-supplier=Element14; ComponentLink3Description: https://datasheet.ciiva.com/7746/1738695-7746360.pdf?src-supplier=Element14; ComponentLink4URL: https://datasheet.ciiva.com/7660/1868787-7660793.pdf?src-supplier=Element14; ComponentLink4Description: https://datasheet.ciiva.com/7660/1868787-7660793.pdf?src-supplier=Element14; ComponentLink5URL: https://datasheet.ciiva.com/46440/1868787-46440907.pdf?src-supplier=Element14; ComponentLink5Description: https://datasheet.ciiva.com/46440/1868787-46440907.pdf?src-supplier=Element14; ComponentLink6URL: https://datasheet.ciiva.com/2454/pyu-r-int-thick-7-2454012.pdf?src-supplier=Digi-Key; ComponentLink6Description: https://datasheet.ciiva.com/2454/pyu-r-int-thick-7-2454012.pdf?src-supplier=Digi-Key; ComponentLink7URL: https://datasheet.ciiva.com/2454/pyu-r-int-thick-7-2454013.pdf?src-supplier=Digi-Key; ComponentLink7Description: https://datasheet.ciiva.com/2454/pyu-r-int-thick-7-2454013.pdf?src-supplier=Digi-Key; ComponentLink8URL: https://datasheet.ciiva.com/2454/pyu-r-int-thick-7-2454014.pdf?src-supplier=Digi-Key; ComponentLink8Description: https://datasheet.ciiva.com/2454/pyu-r-int-thick-7-2454014.pdf?src-supplier=Digi-Key; Supplier Part Number 1: 311-470HRCT-ND; LCSC Part Number: C114669
R82 = RC0603FR-0710KL: RES SMD 10K Ohm 1% 1/10W 0603; Manufacturer: Yageo; Voltage Rating: 75V; Resistance: 10kR; Power Rating: 100mW; Temperature Coefficient: 100ppm/°C; Voltage Rating (DC): 50V; Supplier 1: Digi-Key; Manufacturer Part Number: RC0603FR-0710KL; RoHS: Yes; Category: Chip SMD Resistors; Stock 1: 25249139; Pricing 1: 1=0.10000, 10=0.02400, 100=0.00970, 1000=0.00436, 2500=0.00378 (USD); Case/Package: 0603; Case Code (Imperial): 0603; Case Code (Metric): 1608; Size Code: 0603; Min Operating Temperature: -55°C; Max Operating Temperature: 155°C; Packaging: Tape and Reel; Tolerance: 1%; Resistor Type: Thick Film; Termination: SMD/SMT; Number of Terminations: 2; Max Power Dissipation: 100mW; Features: Moisture Resistant; Series: RC; Construction: Rectangular; Length: 1.6mm; Width: 0.8mm; Height: 0.45mm; Depth: 0.8mm; Military Standard: Not; Lead Free: Lead Free; RoHS Compliant: Yes; ComponentLink1URL: https://datasheet.ciiva.com/7660/38590-7660789.pdf?src-supplier=Element14; ComponentLink1Description: https://datasheet.ciiva.com/7660/38590-7660789.pdf?src-supplier=Element14; Supplier Part Number 1: 311-10.0KHRCT-ND; Number of Pins: 2; Weight: 7.1E-05oz; Resistance Tolerance: 1%; Lead Pitch: 0.3mm; REACH SVHC: Unknown; ComponentLink2URL: https://datasheet.ciiva.com/7983/443971-7983596.pdf?src-supplier=Element14; ComponentLink2Description: https://datasheet.ciiva.com/7983/443971-7983596.pdf?src-supplier=Element14; ComponentLink3URL: https://datasheet.ciiva.com/22747/443971-22747519.pdf?src-supplier=Element14; ComponentLink3Description: https://datasheet.ciiva.com/22747/443971-22747519.pdf?src-supplier=Element14; ComponentLink4URL: https://datasheet.ciiva.com/46440/1868787-46440891.pdf?src-supplier=Element14; ComponentLink4Description: https://datasheet.ciiva.com/46440/1868787-46440891.pdf?src-supplier=Element14; ComponentLink5URL: https://datasheet.ciiva.com/7746/1738695-7746239.pdf?src-supplier=Element14; ComponentLink5Description: https://datasheet.ciiva.com/7746/1738695-7746239.pdf?src-supplier=Element14; ComponentLink6URL: https://datasheet.ciiva.com/15189/getdatasheetpartid-409289-15189591.pdf?src-supplier=Verical; ComponentLink6Description: https://datasheet.ciiva.com/15189/getdatasheetpartid-409289-15189591.pdf?src-supplier=Verical; LCSC Part Number: C98220
R117 R118 = RC0603JR-070RL: RES 0 OHM JUMPER 1/10W 0603; Manufacturer: Yageo; Resistance: 0mR; Tolerance: 1%; Power Rating: 100mW; Voltage Rating (DC): 50V; Temperature Coefficient: 200ppm/°C; Resistance Tolerance: 5%; Supplier 1: Digi-Key; Manufacturer Part Number: RC0603JR-070RL; RoHS: Yes; Category: Chip SMD Resistors; Stock 1: 18081776; Pricing 1: 1=0.10000, 10=0.01700, 25=0.01240, 50=0.00960, 100=0.00700, 250=0.00536, 500=0.00430, 1000=0.00316 (USD); Case/Package: 0603; Number of Pins: 2; Contact Plating: Tin,Matte; Case Code (Imperial): 0603; Case Code (Metric): 1608; Size Code: 0603; Min Operating Temperature: -55°C; Max Operating Temperature: 155°C; Resistor Type: Thick Film; Packaging: Tape and Reel; Termination: SMD/SMT; Series: RC; Technology: THICK FILM; Package Quantity: 5000; Voltage Rating: 50V; Features: Moisture Resistant; Max Power Dissipation: 100mW; Number of Terminations: 2; Construction: Rectangular; Length: 1.6mm; Width: 0.8mm; Height: 0.45mm; Depth: 0.8mm; Radiation Hardening: No; Reach SVHC Compliant: No SVHC; Lead Free: Lead Free; RoHS Compliant: Yes; Military Standard: Not; Supplier Part Number 1: 311-0.0GRCT-ND
SB9 SB39 = Solder Bridge: Solder Bridge ON
U13 = TPS3700DDCR: SOT-23-6 Comparators ROHS; Manufacturer: Texas Instruments; Min Supply Voltage: 1.8V; Max Supply Voltage: 18V; Number of Elements: 2; Quiescent Current: 11uA; Propagation Delay: 29us; Hysteresis: 5.5mV; Number of Channels: 1; Nominal Supply Current: 7uA; Undervoltage Threshold: 1.7V; Operating Supply Current: 5.5uA; Watchdog Timer: No; Supplier 1: Mouser; Manufacturer Part Number: TPS3700DDCR; RoHS: Yes; Category: Comparators; Pricing 1: 1=2.75000, 10=2.48000, 25=2.34000, 50=2.34000, 100=2.00000, 250=1.87000, 500=1.64000, 1000=1.36000, 3000=1.35000, 10000=1.35000 (USD); Mount: Surface Mount; Case/Package: SOT; Number of Pins: 6; Min Operating Temperature: -40°C; Max Operating Temperature: 125°C; Packaging: Tape and Reel; Package Quantity: 3000; Number of Voltages Monitored: 2; Series: TPS3700; Supply Current: 7uA; Radiation Hardening: No; Lead Free: Lead Free; RoHS Compliant: Yes; REACH SVHC: No SVHC; ComponentLink1URL: https://datasheet.ciiva.com/15106/getdatasheetpartid-496993-15106246.pdf?src-supplier=Verical; ComponentLink1Description: https://datasheet.ciiva.com/15106/getdatasheetpartid-496993-15106246.pdf?src-supplier=Verical; ComponentLink2URL: https://datasheet.ciiva.com/22693/1882693-22693543.pdf?src-supplier=Element14; ComponentLink2Description: https://datasheet.ciiva.com/22693/1882693-22693543.pdf?src-supplier=Element14; ComponentLink3URL: https://datasheet.ciiva.com/6625/tps3700-6625126.pdf?src-supplier=Digi-Key; ComponentLink3Description: https://datasheet.ciiva.com/6625/tps3700-6625126.pdf?src-supplier=Digi-Key; ComponentLink4URL: https://datasheet.ciiva.com/6625/tps3700-6625125.pdf?src-supplier=Digi-Key; ComponentLink4Description: https://datasheet.ciiva.com/6625/tps3700-6625125.pdf?src-supplier=Digi-Key; ComponentLink5URL: https://datasheet.ciiva.com/6625/tps3700-6625129.pdf?src-supplier=Digi-Key; ComponentLink5Description: https://datasheet.ciiva.com/6625/tps3700-6625129.pdf?src-supplier=Digi-Key; ComponentLink6URL: https://datasheet.ciiva.com/14204/tps3700-14204199.pdf?src-supplier=Avnet; ComponentLink6Description: https://datasheet.ciiva.com/14204/tps3700-14204199.pdf?src-supplier=Avnet; Supplier Part Number 1: 595-TPS3700DDCR

## Sheet Regulator_Section.SchDoc
size 420 x 297 mm; DocumentNumber: 6; SheetNumber: 6; SheetTotal: 17
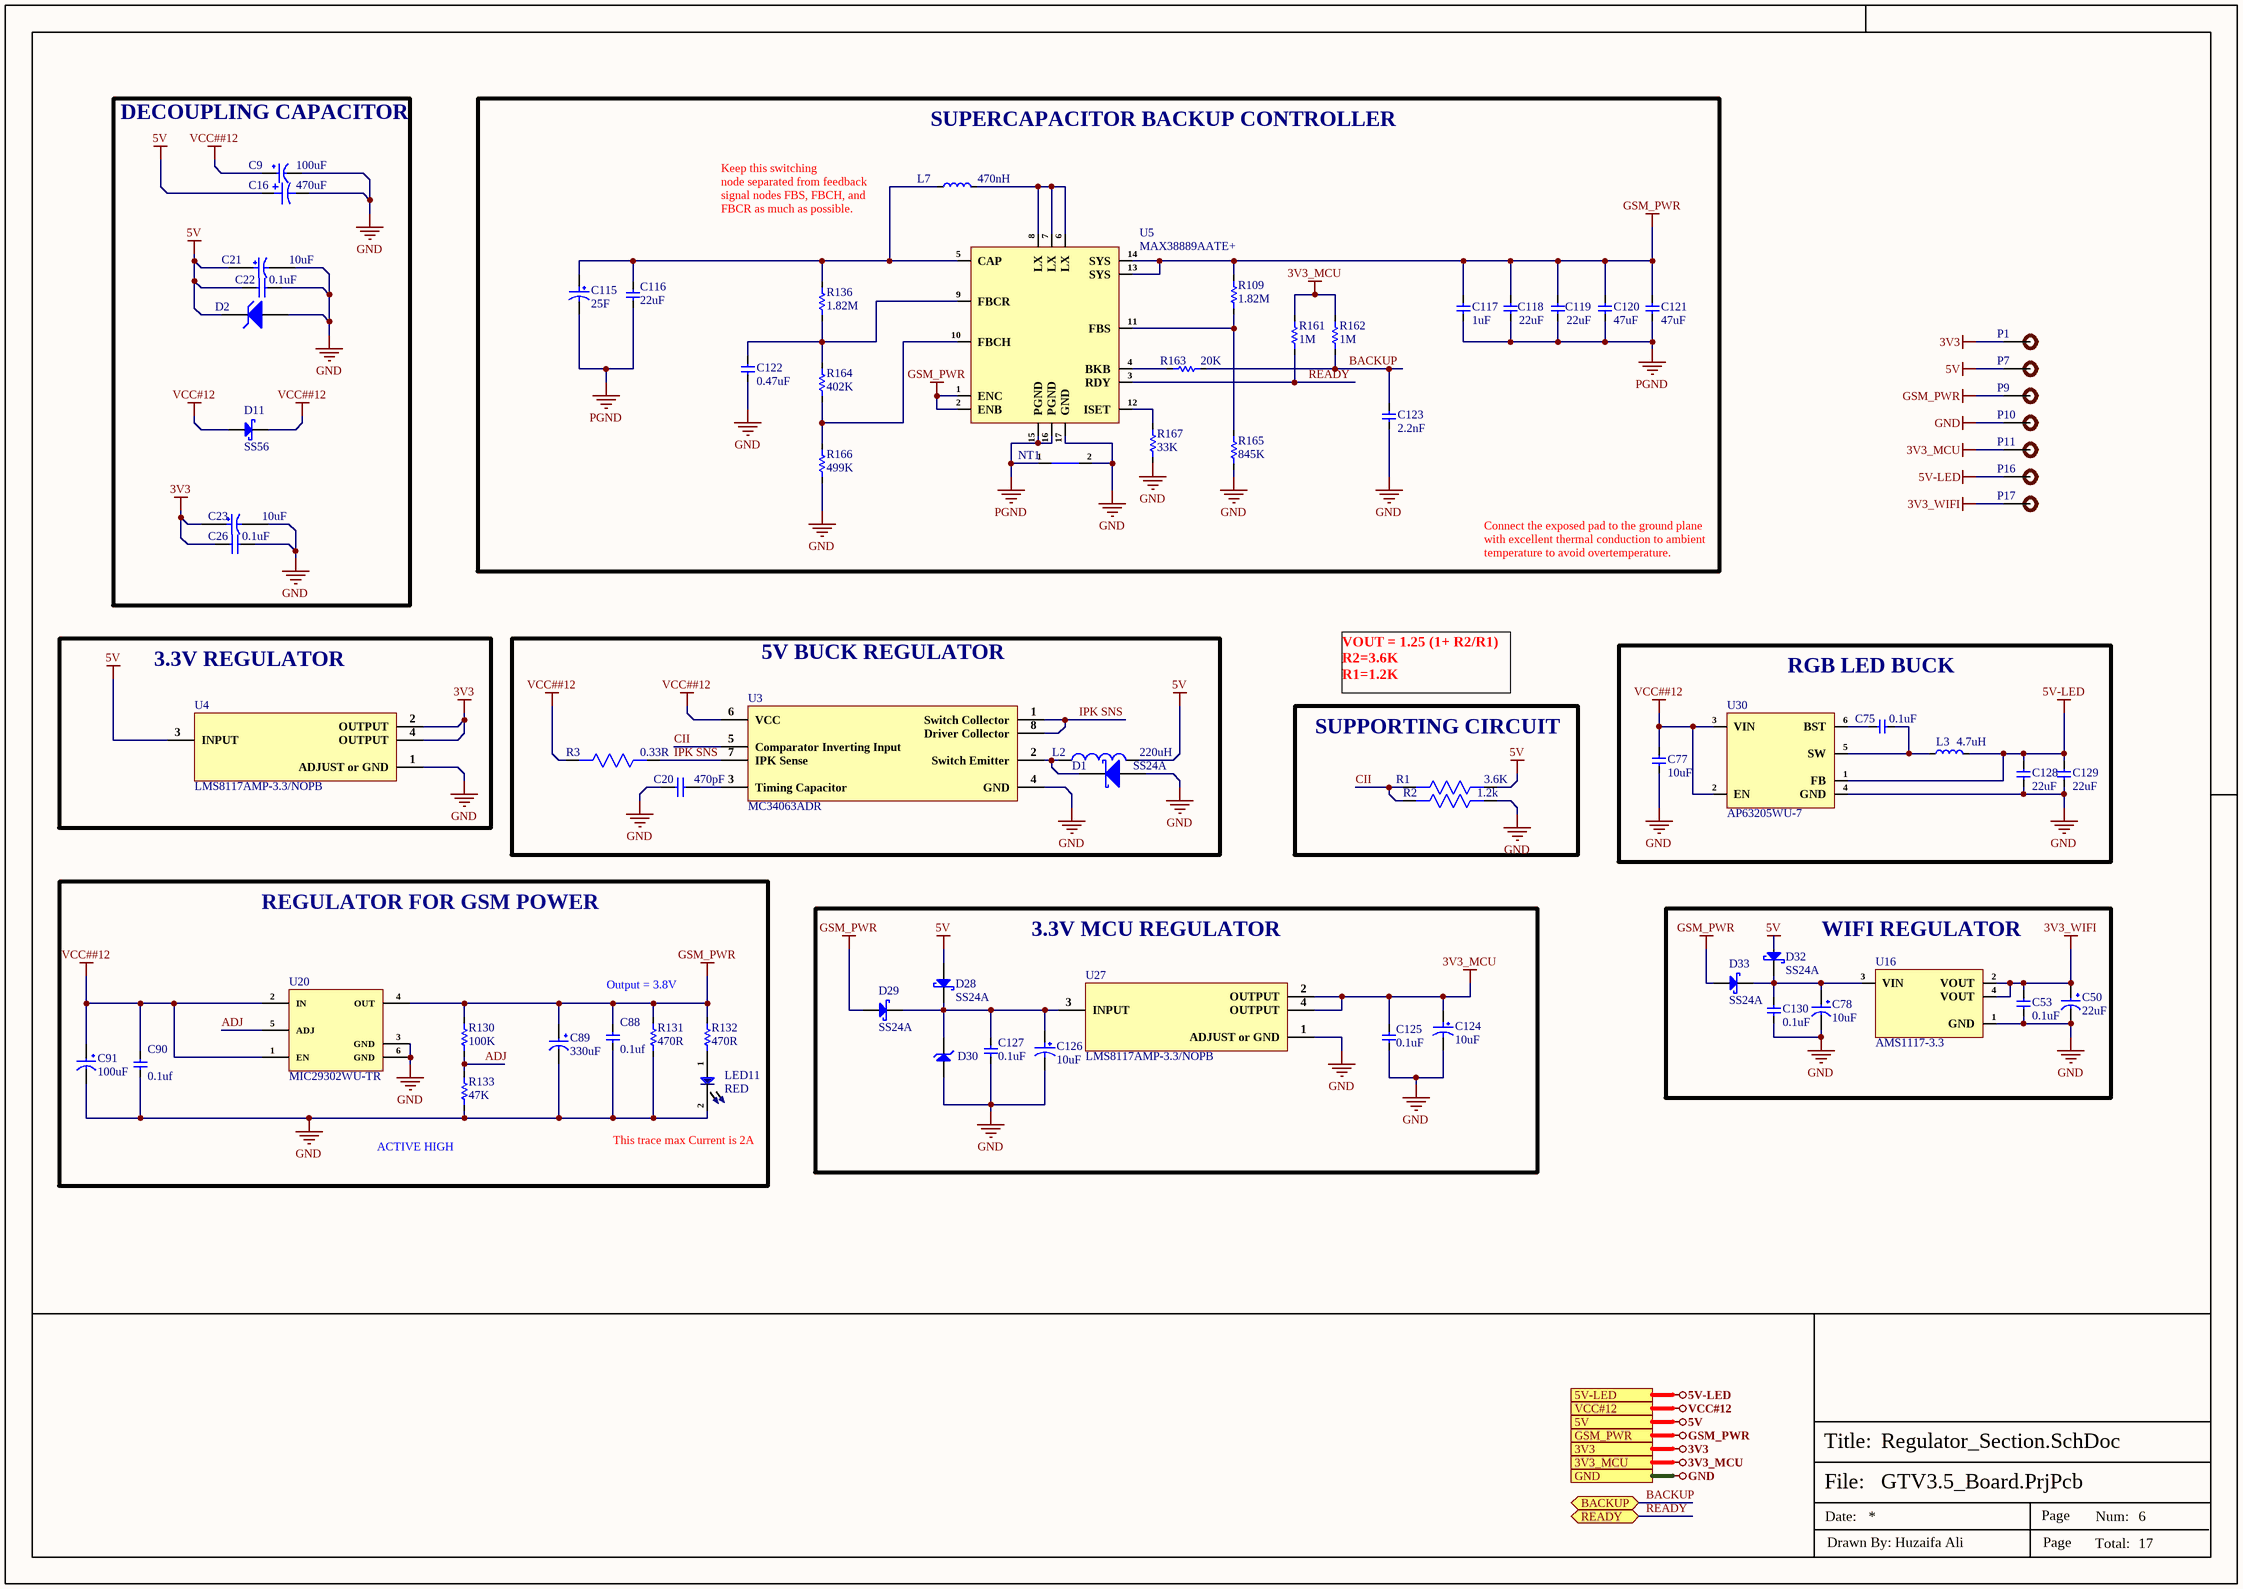
[diagram p4: Regulator_Section.SchDoc]

### Parts
C9  100uF  [UWX1E101MCL1GB]
C16  470uF  [VT1H471MI135000CE0]
C20  470pF  [Cap0603]
C21  10uF  [RVT1E100M0405.]
C22  0.1uF  [Cap0603]
C23  10uF  [RVT1E100M0405.]
C26  0.1uF  [Cap0603]
C50  22uF  [Tant-0805]
C53  0.1uF  [Cap-0402]
C75  0.1uF  [Cap-0402]
C77  10uF  [Cap-0603]
C78  10uF  [Tant-0603]
C88  0.1uf  [Cap-0402]
C89  330uF  [Case-E]
C90  0.1uf  [Cap-0402]
C91  100uF  [Case-B]
C115  25F  [SCCU25B256SRB]
C116  22uF  [Cap-0805]
C117  1uF  [Cap-0603]
C118  22uF  [Cap-0805]
C119  22uF  [Cap-0805]
C120  47uF  [Cap-1206]
C121  47uF  [Cap-1206]
C122  0.47uF  [Cap-0603]
C123  2.2nF  [Cap-0603]
C124  10uF  [RVT1E100M0405_]
C125  0.1uF  [Cap-0603]
C126  10uF  [RVT1E100M0405_]
C127  0.1uF  [Cap-0603]
C128  22uF  [Cap-0603]
C129  22uF  [Cap-0603]
C130  0.1uF  [Cap-0402]
D1  SS24A  [SMA]
D2  1SMA5930BT3G  [SMA]  (value not drawn)
D11  SS56  [SMA]
D28  SS24A  [SMA]
D29  SS24A  [SMA]
D30  1SMA5930BT3G  [SMA]  (value not drawn)
D32  SS24A  [SMA]
D33  SS24A  [SMA]
L2  220uH  [SLF12575T-221M1R3-PF]
L3  4.7uH  [YPRH0704-4R7M]
L7  470nH  [Inductor 1008]
LED11  RED  [LED-0603]
NT1  Net Tie_SMD  [Net Tie Pad]  (value not drawn)  (net tie, no BOM)
P1  TEST POINT 0.5mm Dia  [Test-point - 0.5mm]  (value not drawn)
P7  TEST POINT 0.5mm Dia  [Test-point - 0.5mm]  (value not drawn)
P9  TEST POINT 0.5mm Dia  [Test-point - 0.5mm]  (value not drawn)
P10  TEST POINT 0.5mm Dia  [Test-point - 0.5mm]  (value not drawn)
P11  TEST POINT 0.5mm Dia  [Test-point - 0.5mm]  (value not drawn)
P16  TEST POINT 0.5mm Dia  [Test-point - 0.5mm]  (value not drawn)
P17  TEST POINT 0.5mm Dia  [Test-point - 0.5mm]  (value not drawn)
R1  3.6K  [RES-0603]
R2  1.2k  [RES-0603]
R3  0.33R  [RES-0603]
R109  1.82M  [Res-0603]
R130  100K  [Res-0201]
R131  470R  [Res-0603]
R132  470R  [Res-0201]
R133  47K  [Res-0402]
R136  1.82M  [Res-0603]
R161  1M  [Res-0603]
R162  1M  [Res-0603]
R163  20K  [Res-0603]
R164  402K  [Res-0603]
R165  845K  [Res-0603]
R166  499K  [Res-0603]
R167  33K  [Res-0603]
U3  MC34063ADR  [SOIC-8]
U4  LMS8117AMP-3.3/NOPB  [SOT-223]
U5  MAX38889AATE+  [16-QFN (3x3).]
U16  AMS1117-3.3  [SOT- 223]
U20  MIC29302WU-TR  [TO-263-5 (D2PAK)]
U27  LMS8117AMP-3.3/NOPB  [SOT- 223]
U30  AP63205WU-7  [TSOT-23-6]

### Blocks framed on the sheet
DECOUPLING CAPACITOR: C9 C16 C21-C23 C26 D2 D11
SUPERCAPACITOR BACKUP CONTROLLER: C115-C123 L7 NT1 R109 R136 R161-R167 U5
3.3V REGULATOR: U4
5V BUCK REGULATOR: C20 D1 L2 R3 U3
RGB LED BUCK: C75 C77 C128 C129 L3 U30
SUPPORTING CIRCUIT: R1 R2
REGULATOR FOR GSM POWER: C88-C91 LED11 R130-R133 U20
3.3V MCU REGULATOR: C124-C127 D28-D30 U27
WIFI REGULATOR: C50 C53 C78 C130 D32 D33 U16

### Ports
3V3, 3V3_MCU, 5V, 5V-LED, BACKUP (bidir), GND, GSM_PWR, READY (bidir), VCC#12

### Nets
3V3: C23.1 C26.1 P1.1 U4.2(OUTPUT) U4.4(OUTPUT) ; port 3V3
3V3_MCU: C124.1 C125.2 P11.1 R161.2 R162.2 U27.2(OUTPUT) U27.4(OUTPUT) ; port 3V3_MCU
3V3_WIFI: C50.1 C53.2 P17.1 U16.2(VOUT) U16.4(VOUT)
5V: C16.1 C21.1 C22.1 D2.1(K) D28.2(A) D32.2(A) L2.2 P7.1 R1.1 U4.3(INPUT) ; port 5V
5V-LED: C128.2 C129.2 L3.2 P16.1 U30.1(FB) ; port 5V-LED
GND: C9.2 C16.2 C20.1 C21.2 C22.2 C23.2 C26.2 C50.2 C53.1 C77.1 C78.2 C88.1 C89.2 C90.1 C91.2 C122.1 C123.1 C124.2 C125.1 C126.2 C127.1 C128.1 C129.1 C130.1 D1.2(A) D2.2(A) D30.2(A) LED11.2 NT1.2 P10.1 R2.1 R131.1 R133.1 R165.1 R166.1 R167.1 U3.4(GND) U4.1(ADJUST_or_GND) U5.17(GND) U16.1(GND) U20.3(GND) U20.6(GND) U27.1(ADJUST_or_GND) U30.4(GND) ; port GND
GSM_PWR: C88.2 C89.1 C117.2 C118.2 C119.2 C120.2 C121.2 D29.2(A) D33.2(A) P9.1 R109.2 R130.2 R131.2 R132.2 U5.1(ENC) U5.2(ENB) U5.13(SYS) U5.14(SYS) U20.4(OUT) ; port GSM_PWR
PGND: C115.2 C116.1 C117.1 C118.1 C119.1 C120.1 C121.1 NT1.1 U5.15(PGND) U5.16(PGND)
VCC#12: D11.2(A) ; port VCC#12
VCC##12: C9.1 C77.2 C90.2 C91.1 D11.1(K) R3.2 U3.6(VCC) U20.1(EN) U20.2(IN) U30.2(EN) U30.3(VIN)
ADJ: R130.1 R133.2 U20.5(ADJ)
BACKUP: C123.2 R162.1 R163.2 ; port BACKUP
CII: R1.2 R2.2 U3.5(Comparator_Inverting_Input)
IPK SNS: R3.1 U3.1(Switch_Collector) U3.7(IPK_Sense) U3.8(Driver_Collector)
READY: R161.1 U5.3(RDY) ; port READY
NetC20_2: C20.2 U3.3(Timing_Capacitor)
NetC75_1: C75.1 L3.1 U30.5(SW)
NetC75_2: C75.2 U30.6(BST)
NetC78_1: C78.1 C130.2 D32.1(K) D33.1(K) U16.3(VIN)
NetC115_1: C115.1 C116.2 L7.1 R136.2 U5.5(CAP)
NetC122_2: C122.2 R136.1 R164.2 U5.9(FBCR)
NetC126_1: C126.1 C127.2 D28.1(K) D29.1(K) D30.1(K) U27.3(INPUT)
NetD1_1: D1.1(K) L2.1 U3.2(Switch_Emitter)
NetL7_2: L7.2 U5.6(LX) U5.7(LX) U5.8(LX)
NetLED11_1: LED11.1 R132.1
NetR109_1: R109.1 R165.2 U5.11(FBS)
NetR163_1: R163.1 U5.4(BKB)
NetR164_1: R164.1 R166.2 U5.10(FBCH)
NetR167_2: R167.2 U5.12(ISET)

### Notes on the sheet
- Keep this switching
  node separated from feedback signal nodes FBS, FBCH, and FBCR as much as possible.
- Connect the exposed pad to the ground plane with excellent thermal conduction to ambient temperature to avoid overtemperature.
- VOUT = 1.25 (1+ R2/R1)
  R2=3.6K
  R1=1.2K
- Output = 3.8V
- (near R133) ACTIVE HIGH
- (near LED11) This trace max Current is 2A
- File:
- Title:
- Date:
- Page
- Num:
- Total:
- Drawn By: Huzaifa Ali